# Altium schematic sheet Differential_Drive_Mixer.SchDoc
size A; SheetNumber: 2; SheetTotal: 7
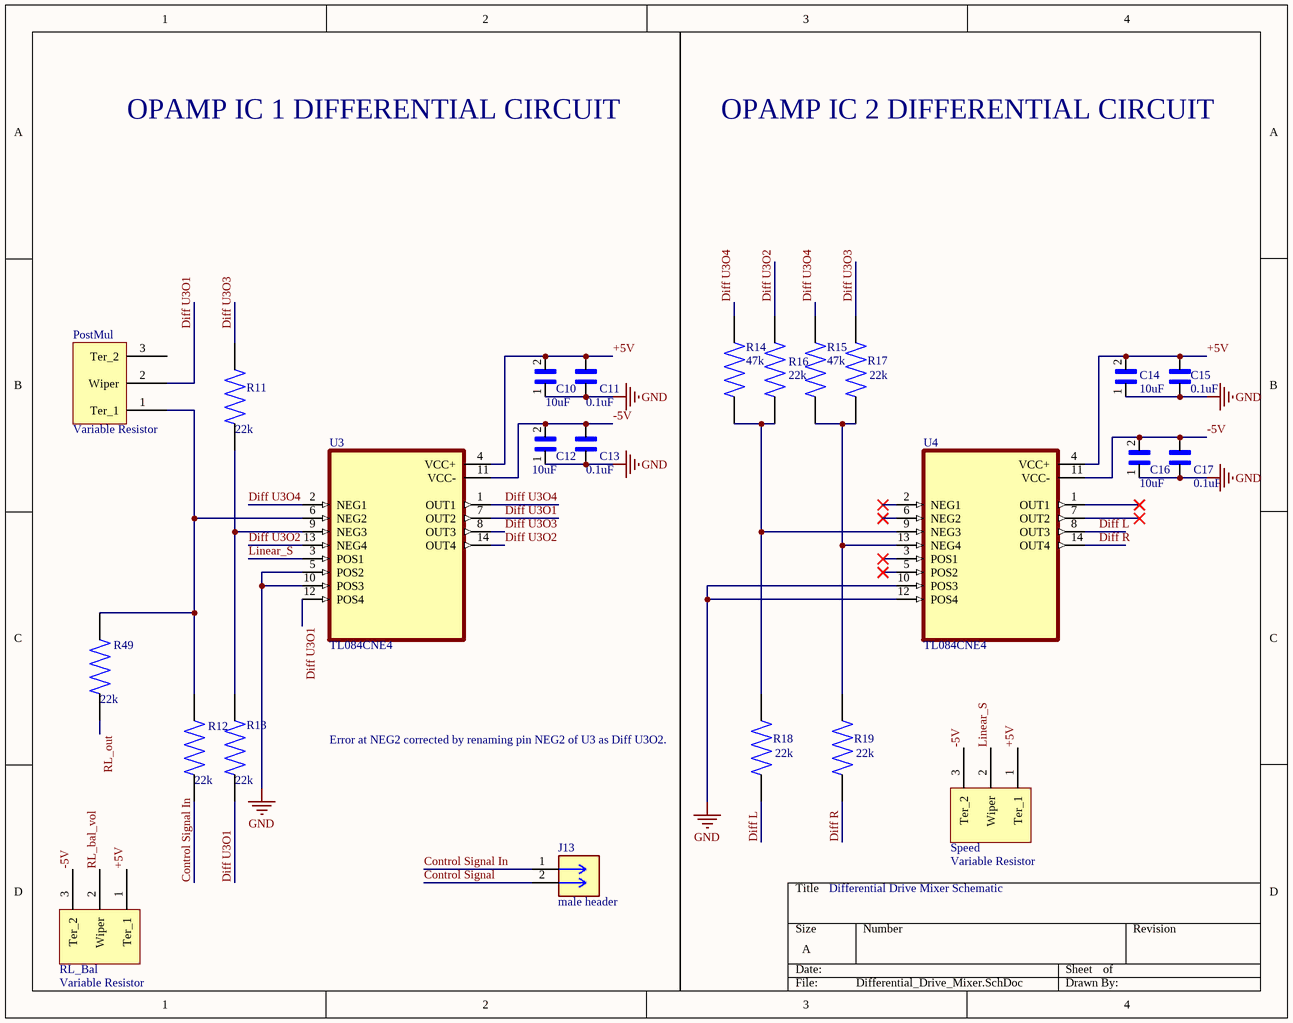
[diagram p0: Differential_Drive_Mixer.SchDoc]

## Parts
C10  10uF  [CAPC2012X145N]
C11  0.1uF  [CAPC2012X140N]
C12  10uF  [CAPC2012X145N]
C13  0.1uF  [CAPC2012X140N]
C14  10uF  [CAPC2012X145N]
C15  0.1uF  [CAPC2012X140N]
C16  10uF  [CAPC2012X145N]
C17  0.1uF  [CAPC2012X140N]
J13  male header  [CONN02_901200922_MOL]
PostMul  Variable Resistor  [PCBComponent_1]
R11  22k  [RESC2012X65N]
R12  22k  [RESC2012X65N]
R13  22k  [RESC2012X65N]
R14  47k  [RESC2012X65N]
R15  47k  [RESC2012X65N]
R16  22k  [RESC2012X65N]
R17  22k  [RESC2012X65N]
R18  22k  [RESC2012X65N]
R19  22k  [RESC2012X65N]
R49  22k  [RESC2012X65N]
RL_Bal  Variable Resistor  [PCBComponent_1]
Speed  Variable Resistor  [PCBComponent_1]
U3  TL084CNE4  [SOIC127P780X200-14N]
U4  TL084CNE4  [SOIC127P780X200-14N]

## Nets
GND: C10.1 C11.2 C12.1 C13.2 C14.1 C15.2 C16.1 C17.2 U3.5(POS2) U3.10(POS3) U4.10(POS3) U4.12(POS4)
+5V: C10.2 C11.1 C14.2 C15.1 RL_Bal.1(Ter_1) Speed.1(Ter_1) U3.4(VCC+) U4.4(VCC+)
-5V: C12.2 C13.1 C16.2 C17.1 RL_Bal.3(Ter_2) Speed.3(Ter_2) U3.11(VCC-) U4.11(VCC-)
Control Signal: J13.2
Control Signal In: J13.1 R12.1
Diff L: R18.2 U4.8(OUT3)
Diff R: R19.2 U4.14(OUT4)
Diff U3O1: PostMul.2(Wiper) R13.1 U3.7(OUT2) U3.12(POS4)
Diff U3O2: R16.1 U3.13(NEG4) U3.14(OUT4)
Diff U3O3: R11.1 R17.1 U3.8(OUT3)
Diff U3O4: R14.2 R15.2 U3.1(OUT1) U3.2(NEG1)
Linear_S: Speed.2(Wiper) U3.3(POS1)
RL_bal_vol: RL_Bal.2(Wiper)
RL_out: R49.1
NetPostMul_1: PostMul.1(Ter_1) R12.2 R49.2 U3.6(NEG2)
NetR11_2: R11.2 R13.2 U3.9(NEG3)
NetR14_1: R14.1 R16.2 R18.1 U4.9(NEG3)
NetR15_1: R15.1 R17.2 R19.1 U4.13(NEG4)

Not connected (* = marked no-connect by the designer): PostMul 3(Ter_2); U4 1(OUT1)* 2(NEG1)* 3(POS1)* 5(POS2)* 6(NEG2)* 7(OUT2)*

## Notes on the sheet
- OPAMP IC 1 DIFFERENTIAL CIRCUIT
- OPAMP IC 2 DIFFERENTIAL CIRCUIT
- (near R18) Error at NEG2 corrected by renaming pin NEG2 of U3 as Diff U3O2.
- Differential Drive Mixer Schematic

## Library data of the parts
C10 C12 C14 C16 = C2012X6S1C106K125AC: C Series 0805 10 uF 16 V Â±10 % Tolerance X6S SMT Multilayer Ceramic Capacitor; MF: TDK; MP: C2012X6S1C106K125AC; SnapEDA_Link: https://www.snapeda.com/parts/C2012X6S1C106K125AC/TDK-Lambda+Americas+Inc/view-part/?ref=snap; Check_prices: https://www.snapeda.com/parts/C2012X6S1C106K125AC/TDK-Lambda+Americas+Inc/view-part/?ref=eda; Value: *; Purchase-URL: https://pricing.snapeda.com/search/part/C2012X6S1C106K125AC/?ref=eda; Package: 2012 TDK
C11 C13 C15 C17 = FS055C104K4Z2A: 0.1 ÂµF Â±10% 50V Ceramic Capacitor X7R 0805 (2012 Metric); MF: AVX; SnapEDA_Link: https://www.snapeda.com/parts/FS055C104K4Z2A/AVX/view-part/?ref=snap; Package: 0805-2 AVX; Value: *; MP: FS055C104K4Z2A; Check_prices: https://www.snapeda.com/parts/FS055C104K4Z2A/AVX/view-part/?ref=eda
J13 = 901200922: Package: None; Price: None; Value: *; MP: 901200922; Availability: Unavailable
R11-R13 R16-R19 R49 = CRGCQ0805F22K: Fixed Resistor CRGCQ 0805 22K 1%; MF: TE Connectivity; SnapEDA_Link: https://www.snapeda.com/parts/CRGCQ0805F22K/TE+Connectivity/view-part/?ref=snap; Package: 2012 TE Connectivity; Value: *; MP: CRGCQ0805F22K; Check_prices: https://www.snapeda.com/parts/CRGCQ0805F22K/TE+Connectivity/view-part/?ref=eda
R14 R15 = CRGCQ0805F47K: Fixed Resistor CRGCQ 0805 47K 1%; MF: TE Connectivity; SnapEDA_Link: https://www.snapeda.com/parts/CRGCQ0805F47K/TE+Connectivity/view-part/?ref=snap; Package: 2012 TE Connectivity; Value: *; MP: CRGCQ0805F47K; Check_prices: https://www.snapeda.com/parts/CRGCQ0805F47K/TE+Connectivity/view-part/?ref=eda
U3 U4 = TL084CNE4: Quad High Slew Rate JFET-Input Operational Amplifier 14-PDIP 0 to 70; MF: Texas Instruments; SnapEDA_Link: https://www.snapeda.com/parts/TL084CNE4/Texas+Instruments/view-part/?ref=snap; Package: PDIP-14 Texas Instruments; Value: *; MP: TL084CNE4; Check_prices: https://www.snapeda.com/parts/TL084CNE4/Texas+Instruments/view-part/?ref=eda